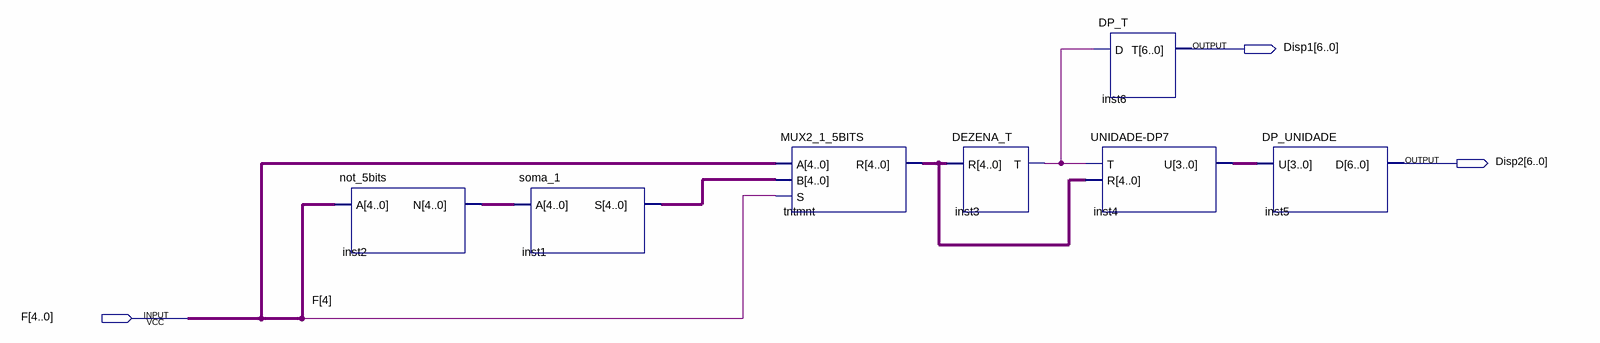
[diagram p0: schematic sheet]
// Quartus schematic Display.bdf as structural Verilog: 7 symbols, 3 pins
module Display (
  input  [4:0] F,
  output [6:0] Disp1,
  output [6:0] Disp2
);

  wire inst3_t;
  wire [3:0] inst4_u;
  wire [4:0] inst1_s, inst2_n, tntmnt_r;

  not_5bits inst2 (.A(F), .N(inst2_n));
  soma_1 inst1 (.A(inst2_n), .S(inst1_s));
  MUX2_1_5BITS tntmnt (.A(F), .B(inst1_s), .S(F[4]), .R(tntmnt_r));
  DEZENA_T inst3 (.R(tntmnt_r), .T(inst3_t));
  DP_T inst6 (.D(inst3_t), .T(Disp1));
  \UNIDADE-DP7  inst4 (.T(inst3_t), .R(tntmnt_r), .U(inst4_u));
  DP_UNIDADE inst5 (.U(inst4_u), .D(Disp2));
endmodule
